# Altium schematic sheet Sheet1-BeforeClearParameters-20261027_173129_074.SchDoc (part 3 of 3)
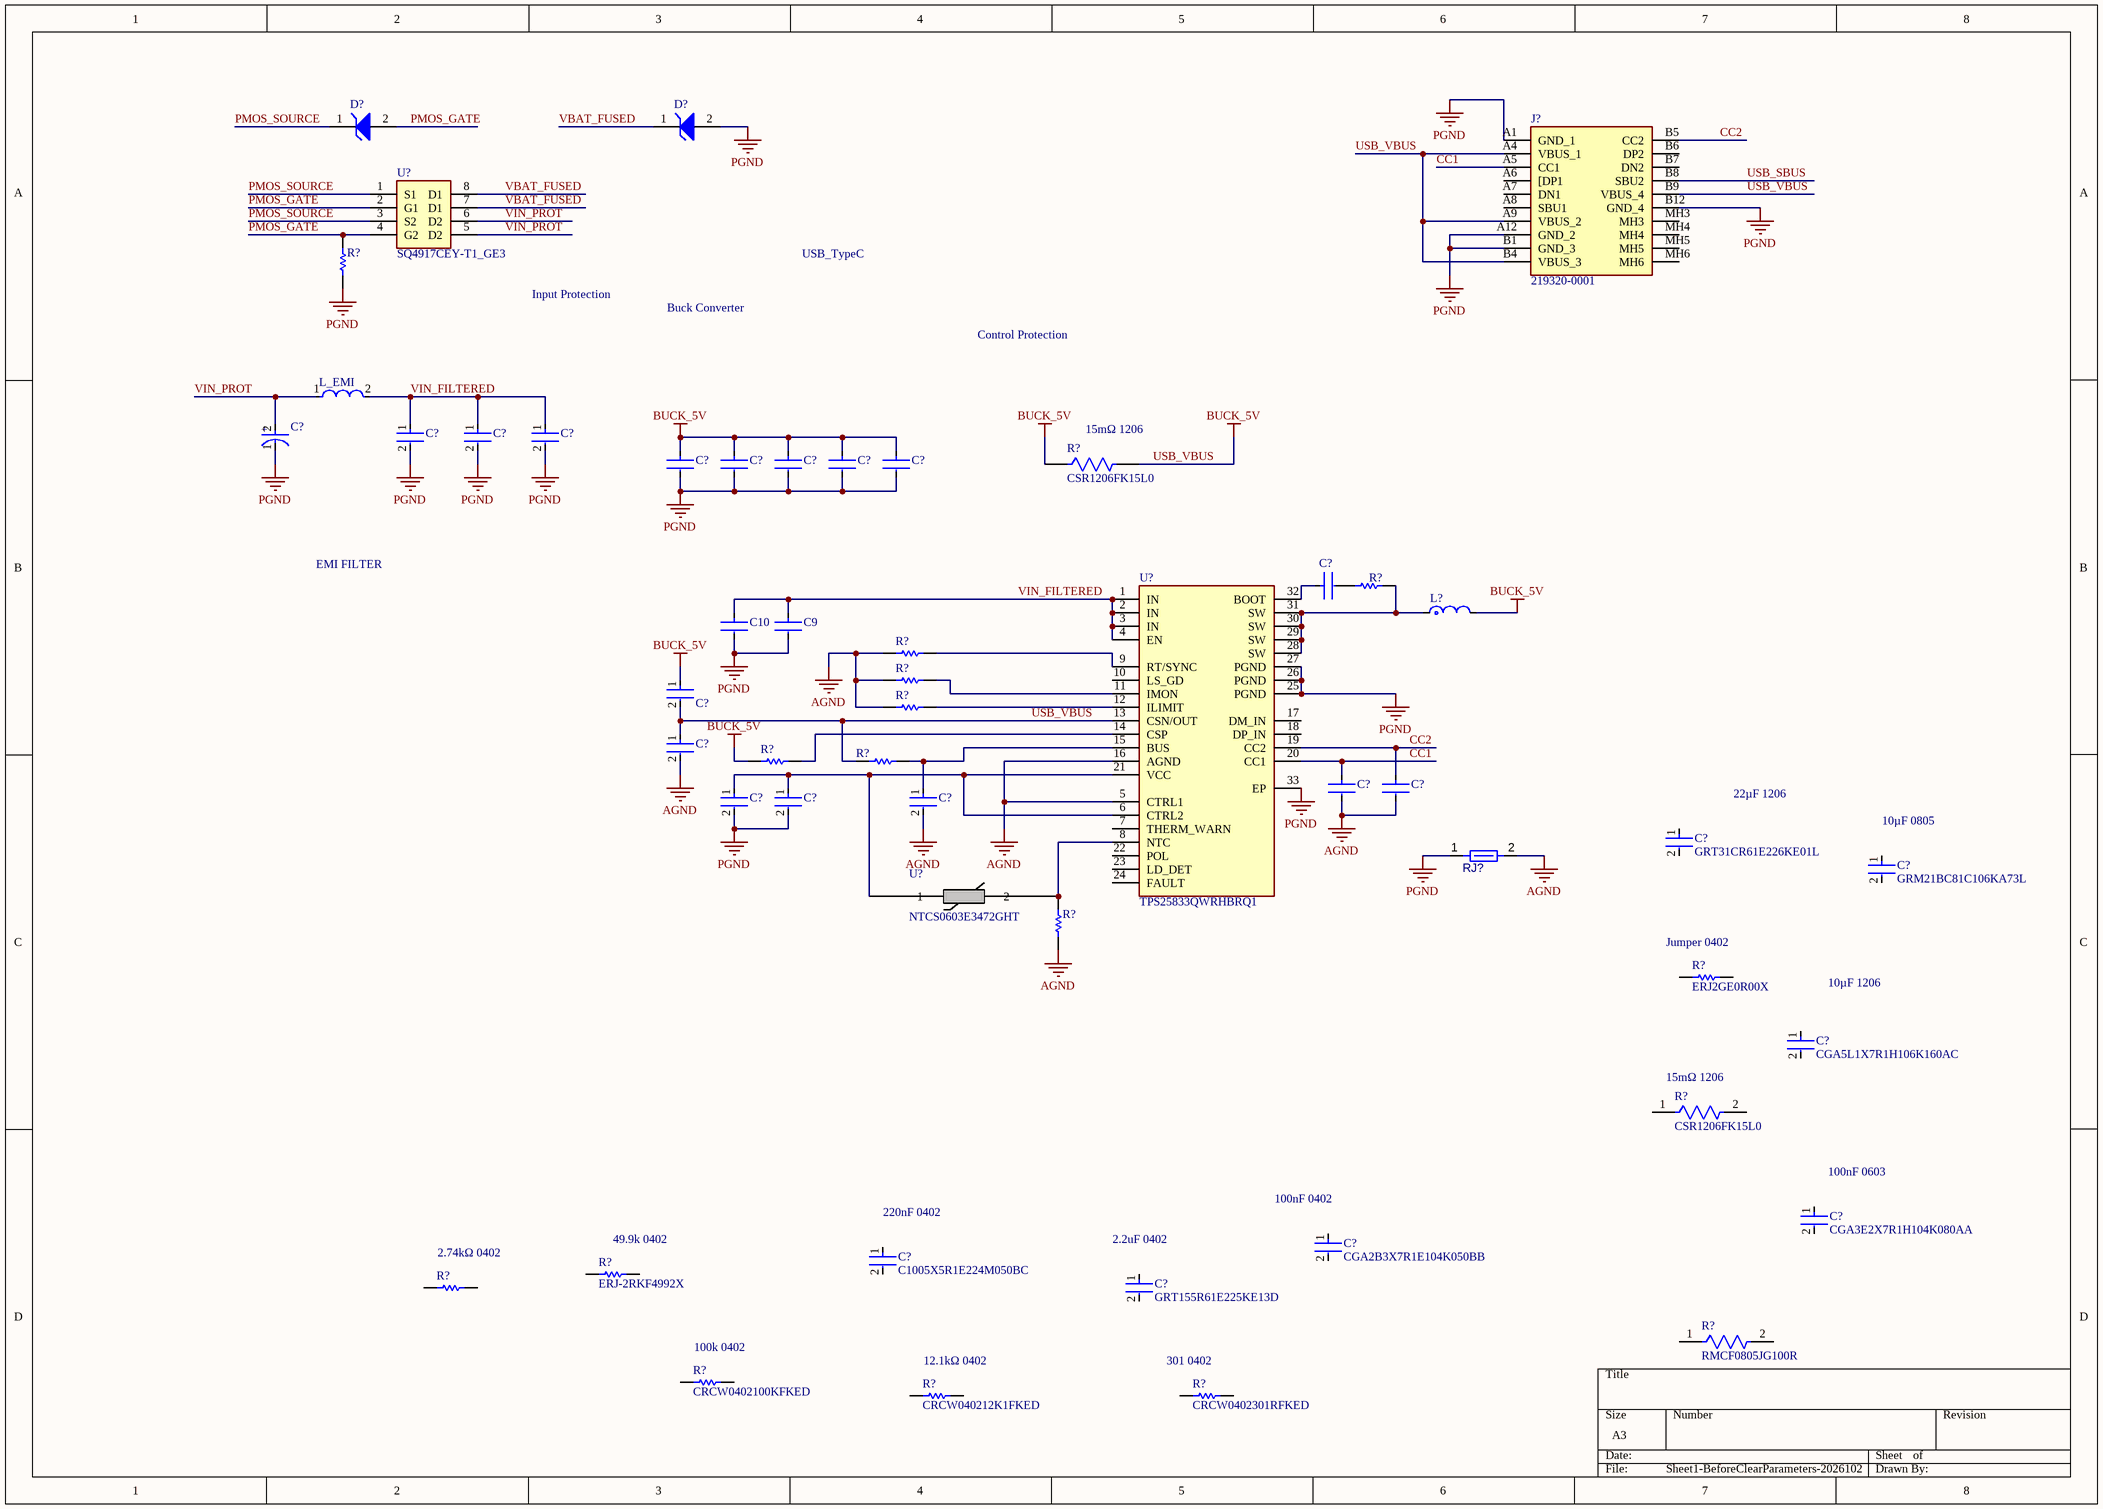
[diagram p2: Sheet1-BeforeClearParameters-20261027_173129_074.SchDoc]

## Library data of the parts (continued)
R?#16 = CMP-2000-07451-1: Manufacturer: Vishay; Max Power Dissipation: 63mW; Value: 12.1kΩ; Temperature Coefficient: 100ppm/°C; Tolerance: 1%; Voltage Rating: 50V; Supplier: Future Electronics; Supplier Part Number: CRCW040212K1FKED; Manufacturer Part Number: CRCW040212K1FKED; RoHS: Compliant; Category: Chip SMD Resistors; Stock: 190000; Pricing: 10000=0.0043, 40000=0.0042, 150000=0.004, 250000=0.0039, 500000=0.0038 (USD); Case/Package: 0402; Case Code (Imperial): 0402; China RoHS: Non-Compliant; Composition: Thick Film; Contact Plating: Tin; Depth: 500µm; Features: Automotive AEC-Q200; Height: 350µm; Lead Free: Lead Free; Length: 1mm; Lifecycle Status: Production; Max Operating Temperature: 155°C; Military Standard: Not; Min Operating Temperature: -55°C; Mounting Technology: Surface Mount; Pins: 2; Number of Terminals: 2; Number of Terminations: 2; Packaging: Cut Tape; Power Rating: 63mW; Radiation Hardening: No; Ratings: AEC-Q200; REACH SVHC: Unaffected; Schedule B: 8533210045, 8533210045|8533210045|8533210045|8533210045|8533210045|8533210045|8533210045|8533210045|8533210045|8533210045|8533210045|8533210045|8533210045|8533210045|8533210045|8533210045|8533210045|8533210045|8533210045|8533210045|8533210045|8533210045|8533210045|85; Termination: SMD/SMT; Voltage Rating (DC): 50V; Weight: 652.039032µg; Width: 500µm; Working Voltage: 50V; ComponentLink1URL: https://datasheet.octopart.com:443/CRCW040212K1FKED-Vishay-datasheet-175423584.pdf?src-supplier=IHS; ComponentLink1Description: https://datasheet.octopart.com:443/CRCW040212K1FKED-Vishay-datasheet-175423584.pdf?src-supplier=IHS; ComponentLink2URL: https://datasheet.octopart.com:443/CRCW040212K1FKED-Vishay-datasheet-83961561.pdf?src-supplier=Newark; ComponentLink2Description: https://datasheet.octopart.com:443/CRCW040212K1FKED-Vishay-datasheet-83961561.pdf?src-supplier=Newark; ComponentLink3URL: https://datasheet.octopart.com:443/CRCW040212K1FKED-Vishay-datasheet-11516975.pdf?src-supplier=Newark; ComponentLink3Description: https://datasheet.octopart.com:443/CRCW040212K1FKED-Vishay-datasheet-11516975.pdf?src-supplier=Newark; ComponentLink4URL: https://datasheet.octopart.com:443/CRCW040212K1FKED-Vishay-datasheet-33013972.pdf?src-supplier=Newark; ComponentLink4Description: https://datasheet.octopart.com:443/CRCW040212K1FKED-Vishay-datasheet-33013972.pdf?src-supplier=Newark; ComponentLink5URL: https://datasheet.octopart.com:443/CRCW040212K1FKED-Vishay-datasheet-21268114.pdf?src-supplier=Newark; ComponentLink5Description: https://datasheet.octopart.com:443/CRCW040212K1FKED-Vishay-datasheet-21268114.pdf?src-supplier=Newark; ComponentLink6URL: https://datasheet.octopart.com:443/CRCW040212K1FKED-Vishay-datasheet-21226360.pdf?src-supplier=Newark; ComponentLink6Description: https://datasheet.octopart.com:443/CRCW040212K1FKED-Vishay-datasheet-21226360.pdf?src-supplier=Newark; ComponentLink7URL: https://datasheet.octopart.com:443/CRCW040212K1FKED-Vishay-datasheet-62317933.pdf?src-supplier=element14+APAC; ComponentLink7Description: https://datasheet.octopart.com:443/CRCW040212K1FKED-Vishay-datasheet-62317933.pdf?src-supplier=element14+APAC; ComponentLink8URL: https://datasheet.octopart.com:443/CRCW040212K1FKED-Vishay-datasheet-10882403.pdf?src-supplier=element14+APAC; ComponentLink8Description: https://datasheet.octopart.com:443/CRCW040212K1FKED-Vishay-datasheet-10882403.pdf?src-supplier=element14+APAC; ComponentLink9URL: https://datasheet.octopart.com:443/CRCW040212K1FKED.-Vishay-datasheet-78776209.pdf?src-supplier=element14+APAC; ComponentLink9Description: https://datasheet.octopart.com:443/CRCW040212K1FKED.-Vishay-datasheet-78776209.pdf?src-supplier=element14+APAC; ComponentLink10URL: https://datasheet.octopart.com:443/CRCW040212K1FKED-Vishay-datasheet-66077789.pdf?src-supplier=element14+APAC; ComponentLink10Description: https://datasheet.octopart.com:443/CRCW040212K1FKED-Vishay-datasheet-66077789.pdf?src-supplier=element14+APAC; ComponentLink11URL: https://datasheet.octopart.com:443/CRCW040212K1FKED-Vishay-datasheet-14722531.pdf?src-supplier=element14+APAC; ComponentLink11Description: https://datasheet.octopart.com:443/CRCW040212K1FKED-Vishay-datasheet-14722531.pdf?src-supplier=element14+APAC; ComponentLink12URL: https://datasheet.octopart.com:443/CRCW040212K1FKED-Vishay-datasheet-5300368.pdf?src-supplier=Future+Electronics; ComponentLink12Description: https://datasheet.octopart.com:443/CRCW040212K1FKED-Vishay-datasheet-5300368.pdf?src-supplier=Future+Electronics; ComponentLink13URL: https://datasheet.octopart.com:443/CRCW040212K1FKED-Vishay-datasheet-62316122.pdf?src-supplier=Future+Electronics; ComponentLink13Description: https://datasheet.octopart.com:443/CRCW040212K1FKED-Vishay-datasheet-62316122.pdf?src-supplier=Future+Electronics; ComponentLink14URL: https://datasheet.octopart.com:443/CRCW040212K1FKED-Vishay-Dale-datasheet-47688880.pdf?src-supplier=RS+(Formerly+Allied+Electronics); ComponentLink14Description: https://datasheet.octopart.com:443/CRCW040212K1FKED-Vishay-Dale-datasheet-47688880.pdf?src-supplier=RS+(Formerly+Allied+Electronics); ComponentLink15URL: https://datasheet.octopart.com:443/CRCW040212K1FKED-Vishay-datasheet-12001583.pdf?src-supplier=RS+(Formerly+Allied+Electronics); ComponentLink15Description: https://datasheet.octopart.com:443/CRCW040212K1FKED-Vishay-datasheet-12001583.pdf?src-supplier=RS+(Formerly+Allied+Electronics); ComponentLink16URL: https://datasheet.octopart.com:443/CRCW040212K1FKED-Vishay-datasheet-5306405.pdf?src-supplier=RS+(Formerly+Allied+Electronics); ComponentLink16Description: https://datasheet.octopart.com:443/CRCW040212K1FKED-Vishay-datasheet-5306405.pdf?src-supplier=RS+(Formerly+Allied+Electronics); ComponentLink17URL: https://datasheet.octopart.com:443/CRCW040212K1FKED-Vishay-datasheet-11540273.pdf?src-supplier=Arrow+Electronics; ComponentLink17Description: https://datasheet.octopart.com:443/CRCW040212K1FKED-Vishay-datasheet-11540273.pdf?src-supplier=Arrow+Electronics; ComponentLink18URL: https://datasheet.octopart.com:443/CRCW040212K1FKED-Vishay-datasheet-8445837.pdf?src-supplier=element14; ComponentLink18Description: https://datasheet.octopart.com:443/CRCW040212K1FKED-Vishay-datasheet-8445837.pdf?src-supplier=element14; ComponentLink19URL: https://datasheet.octopart.com:443/CRCW040212K1FKED-Vishay-datasheet-5377255.pdf?src-supplier=Garrett; ComponentLink19Description: https://datasheet.octopart.com:443/CRCW040212K1FKED-Vishay-datasheet-5377255.pdf?src-supplier=Garrett; ComponentLink20URL: https://datasheet.octopart.com:443/CRCW040212K1FKED-Vishay-datasheet-148188.pdf?src-supplier=Garrett; ComponentLink20Description: https://datasheet.octopart.com:443/CRCW040212K1FKED-Vishay-datasheet-148188.pdf?src-supplier=Garrett; ComponentLink21URL: https://datasheet.octopart.com:443/CRCW040212K1FKED-Vishay-datasheet-42367.pdf?src-supplier=Garrett; ComponentLink21Description: https://datasheet.octopart.com:443/CRCW040212K1FKED-Vishay-datasheet-42367.pdf?src-supplier=Garrett; ComponentLink22URL: http://sigma.octopart.com:80/rohs_statement/Vishay-company-15.pdf?src-supplier=Compliance+Statements; ComponentLink22Description: http://sigma.octopart.com:80/rohs_statement/Vishay-company-15.pdf?src-supplier=Compliance+Statements
RJ? = CMP-009-00120-1: Pins: 2; Max Operating Temperature: 155°C; Min Operating Temperature: -55°C
U?#1 = GeneratedSymbol_2: MOSFET Array, Dual P Channel, 60 V, 8 A, 48 Milliohms, SOIC, 8 Pins, Surface Mount; Manufacturer: Vishay; Continuous Drain Current (ID): 8A; Drain to Source Resistance: 48mΩ; Drain to Source Voltage (Vds): 60V; Max Power Dissipation: 5W; Number of Elements: 2; Supplier: Arrow Electronics; Supplier Part Number: SQ4917CEY-T1_GE3; Manufacturer Part Number: SQ4917CEY-T1_GE3; RoHS: Compliant; Category: MOSFETs; Stock: 5000; Pricing: 1=1.7867, 10=1.158, 50=0.935, 100=0.7846, 500=0.5451, 2500=0.5205 (USD); Country of Origin: Germany; Export Control Classification Number (ECCN) Code: EAR99; Harmonized Tariff Schedule (HTS) Code: 8541.29.00.95; Introduction Date: 2023-02-14; Lifecycle Status: Production; Max Operating Temperature: 175°C; Min Breakdown Voltage: 60V; Min Operating Temperature: -55°C; Number of Terminals: 8; Power Dissipation: 5W; Ratings: AEC-Q101; ComponentLink1URL: https://datasheet.octopart.com:443/SQ4917CEY-T1_GE3-Vishay-datasheet-181474669.pdf?src-supplier=IHS; ComponentLink1Description: https://datasheet.octopart.com:443/SQ4917CEY-T1_GE3-Vishay-datasheet-181474669.pdf?src-supplier=IHS; ComponentLink2URL: http://sigma.octopart.com:80/rohs_statement/Vishay-company-15.pdf?src-supplier=Compliance+Statements; ComponentLink2Description: http://sigma.octopart.com:80/rohs_statement/Vishay-company-15.pdf?src-supplier=Compliance+Statements
U?#2 = CMP-00030-44325454-1: NTCS0603E3472GHT Thermistor NTC 4.7K Ohm 2% 2-Pin 0603 Surface Mount Solder Pad 3830K -4.5 to -4 T/R Automotive; Accuracy: 1%; Resistance: 4.7kΩ; Power Rating: 125mW; Min Operating Temperature: -40°C; Case Code (Imperial): 0603; Packaging: Digi-Reel®; Mount: Surface Mount; Length: 1.6mm; Number of Pins: 2; Case Code (Metric): 1608; RoHS: Compliant; Tolerance: 2%; NexarPartId: 44325454; Contact Plating: Tin; Radiation Hardening: No; Schedule B: 8533400080, 8533400080; Termination: SMD/SMT; Max Operating Temperature: 150°C; Depth: 800µm; Case/Package: 0603; Max Power Dissipation: 125mW
U?#3 = GeneratedSymbol: USB Type-C and BC1.2 5V 3.5A Output 36V Input Synchronous DC/DC Regulator 32-Pin VQFN; Manufacturer: Texas Instruments; Manufacturer Lifecycle Status: ACTIVE; Supplier: Arrow Electronics; Supplier Part Number: TPS25833QWRHBRQ1; Manufacturer Part Number: TPS25833QWRHBRQ1; RoHS: Compliant; Category: USB Interface ICs; Stock: 3000; Pricing: 3000=2.35 (USD); Case/Package: VQFN; Height: 1mm; Length: 5mm; Lifecycle Status: Production; Pins: 32; Schedule B: 8542390000|8542390000; Thickness: 900µm; Width: 5mm; ComponentLink1URL: https://octopart.com:443/opatz8j6/c1?t=QdtQ_5y6OoYO10vGMBHo0MkWWNg3WZcKByxVKRKibkrIArPmB0huZ0PTWgiVQyVM0r-KErAlqgl_GtZqS-zfbTH9MSEVf23tu6zsP7SwoH3cElgJzC1njavEoiPtv5zJyzI5TugnKjD-MwQN_tWNq7D4zs4hg9Jvnjhyur9u1VAzxy-x97OLvkn3T5o38e-A3hbTv1voPLaqbRoeq4uSWuj4oXJZ_6x5obgH2QuRMC6C-RM4You7UXlmIiUE0xXQlfjdTdGh5Mzji6m775kF51dkfg-oVXXT7eQkakUfxTXIZTGRZ9S2Te6OgLonkCf4Q48jzw2hIzpT3B6kxxuzoKhvga5DM2Eb2fh4XFQ3zjw1DN_Mg95a_8n3WVcIjlOyBCLqgiEN8_34Bg&src-supplier=Texas+Instruments; ComponentLink1Description: https://octopart.com:443/opatz8j6/c1?t=QdtQ_5y6OoYO10vGMBHo0MkWWNg3WZcKByxVKRKibkrIArPmB0huZ0PTWgiVQyVM0r-KErAlqgl_GtZqS-zfbTH9MSEVf23tu6zsP7SwoH3cElgJzC1njavEoiPtv5zJyzI5TugnKjD-MwQN_tWNq7D4zs4hg9Jvnjhyur9u1VAzxy-x97OLvkn3T5o38e-A3hbTv1voPLaqbRoeq4uSWuj4oXJZ_6x5obgH2QuRMC6C-RM4You7UXlmIiUE0xXQlfjdTdGh5Mzji6m775kF51dkfg-oVXXT7eQkakUfxTXIZTGRZ9S2Te6OgLonkCf4Q48jzw2hIzpT3B6kxxuzoKhvga5DM2Eb2fh4XFQ3zjw1DN_Mg95a_8n3WVcIjlOyBCLqgiEN8_34Bg&src-supplier=Texas+Instruments; ComponentLink2URL: https://datasheet.octopart.com:443/TPS25833QWRHBRQ1-Texas-Instruments-datasheet-165812046.pdf?src-supplier=SHENGYU+ELECTRONICS; ComponentLink2Description: https://datasheet.octopart.com:443/TPS25833QWRHBRQ1-Texas-Instruments-datasheet-165812046.pdf?src-supplier=SHENGYU+ELECTRONICS; ComponentLink3URL: http://sigma.octopart.com:80/reach_statement/Texas-Instruments-company-64.pdf?src-supplier=Compliance+Statements; ComponentLink3Description: http://sigma.octopart.com:80/reach_statement/Texas-Instruments-company-64.pdf?src-supplier=Compliance+Statements; ComponentLink4URL: http://sigma.octopart.com:80/conflict_mineral_statement/Texas-Instruments-company-63.pdf?src-supplier=Compliance+Statements; ComponentLink4Description: http://sigma.octopart.com:80/conflict_mineral_statement/Texas-Instruments-company-63.pdf?src-supplier=Compliance+Statements